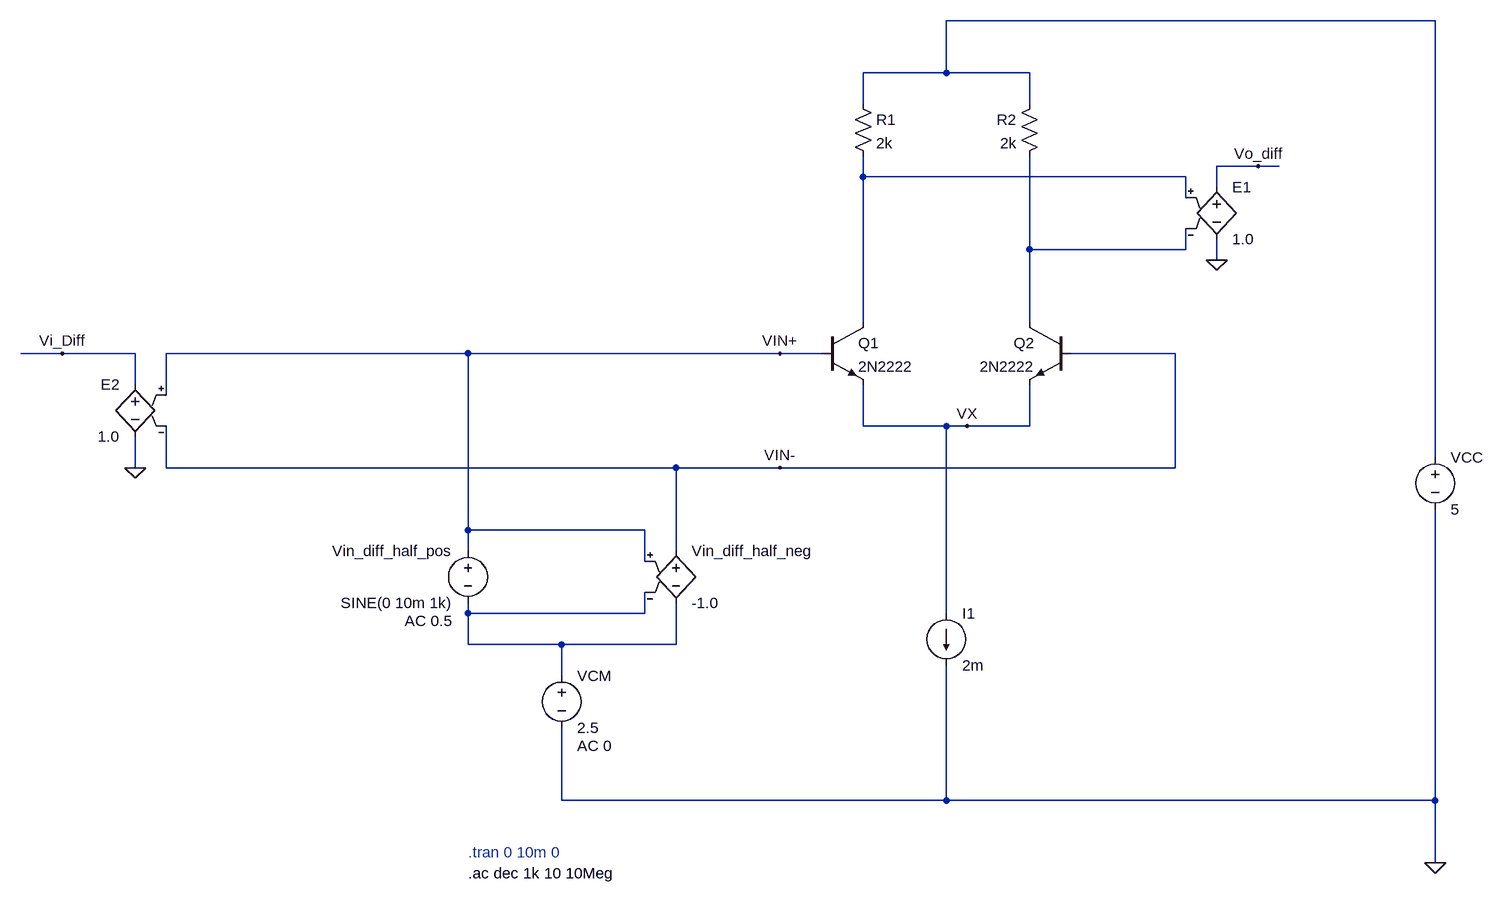
[diagram p0: schematic NPN_Differential_Pair.asc]
NPN_Differential_Pair.asc, the LTspice schematic file:
Version 4.1
SHEET 1 1128 960
WIRE 1056 -368 304 -368
WIRE 304 -288 304 -368
WIRE 304 -288 176 -288
WIRE 432 -288 304 -288
WIRE 176 -240 176 -288
WIRE 432 -240 432 -288
WIRE 784 -144 720 -144
WIRE 816 -144 784 -144
WIRE 176 -128 176 -160
WIRE 672 -128 176 -128
WIRE 720 -112 720 -144
WIRE 672 -96 672 -128
WIRE 432 -16 432 -160
WIRE 672 -16 672 -48
WIRE 672 -16 432 -16
WIRE 720 0 720 -32
WIRE 176 96 176 -128
WIRE 432 96 432 -16
WIRE -1056 144 -1120 144
WIRE -944 144 -1056 144
WIRE -432 144 -896 144
WIRE 48 144 -432 144
WIRE 112 144 48 144
WIRE 656 144 496 144
WIRE -944 192 -944 144
WIRE -896 208 -896 144
WIRE 176 256 176 192
WIRE 304 256 176 256
WIRE 336 256 304 256
WIRE 432 256 432 192
WIRE 432 256 336 256
WIRE 1056 304 1056 -368
WIRE -944 320 -944 272
WIRE -896 320 -896 256
WIRE -112 320 -896 320
WIRE 48 320 -112 320
WIRE 656 320 656 144
WIRE 656 320 48 320
WIRE -432 416 -432 144
WIRE -160 416 -432 416
WIRE -432 448 -432 416
WIRE -112 448 -112 320
WIRE -160 464 -160 416
WIRE -432 544 -432 528
WIRE -160 544 -160 512
WIRE -160 544 -432 544
WIRE 304 544 304 256
WIRE -432 592 -432 544
WIRE -288 592 -432 592
WIRE -112 592 -112 528
WIRE -112 592 -288 592
WIRE -288 640 -288 592
WIRE -288 832 -288 720
WIRE 304 832 304 624
WIRE 304 832 -288 832
WIRE 1056 832 1056 384
WIRE 1056 832 304 832
WIRE 1056 928 1056 832
FLAG 1056 928 0
FLAG 720 0 0
FLAG 784 -144 Vo_diff
FLAG 48 144 VIN+
FLAG 48 320 VIN-
FLAG 336 256 VX
FLAG -944 320 0
FLAG -1056 144 Vi_Diff
SYMBOL npn 112 96 R0
SYMATTR InstName Q1
SYMATTR Value 2N2222
SYMBOL npn 496 96 M0
SYMATTR InstName Q2
SYMATTR Value 2N2222
SYMBOL res 160 -256 R0
SYMATTR InstName R1
SYMATTR Value 2k
SYMBOL res 448 -256 M0
SYMATTR InstName R2
SYMATTR Value 2k
SYMBOL voltage 1056 288 R0
WINDOW 123 0 0 Left 0
WINDOW 39 0 0 Left 0
SYMATTR InstName VCC
SYMATTR Value 5
SYMBOL voltage -288 624 R0
WINDOW 123 24 124 Left 2
WINDOW 39 0 0 Left 0
SYMATTR InstName VCM
SYMATTR Value 2.5
SYMATTR Value2 AC 0
SYMBOL voltage -432 432 M0
WINDOW 123 24 124 Left 2
WINDOW 39 0 0 Left 0
SYMATTR InstName Vin_diff_half_pos
SYMATTR Value SINE(0 10m 1k)
SYMATTR Value2 AC 0.5
SYMBOL e -112 432 R0
SYMATTR InstName Vin_diff_half_neg
SYMATTR Value -1.0
SYMBOL e 720 -128 R0
SYMATTR InstName E1
SYMATTR Value 1.0
SYMBOL e -944 176 M0
SYMATTR InstName E2
SYMATTR Value 1.0
SYMBOL current 304 544 R0
WINDOW 123 0 0 Left 0
WINDOW 39 0 0 Left 0
SYMATTR InstName I1
SYMATTR Value 2m
TEXT -432 912 Left 2 ;.tran 0 10m 0
TEXT -432 944 Left 2 !.ac dec 1k 10 10Meg

The netlist it stands for:
* NPN_Differential_Pair.asc
Q1 N002 VIN+ VX 0 2N2222
Q2 N003 VIN- VX 0 2N2222
R1 N001 N002 2k
R2 N001 N003 2k
VCC N001 0 5
VCM N004 0 2.5 AC 0
Vin_diff_half_pos VIN+ N004 SINE(0 10m 1k) AC 0.5
E§Vin_diff_half_neg VIN- N004 VIN+ N004 -1.0
E1 Vo_diff 0 N002 N003 1.0
E2 Vi_Diff 0 VIN+ VIN- 1.0
I1 VX 0 2m
.model NPN NPN
.model PNP PNP
.lib standard.bjt
* .tran 0 10m 0
.ac dec 1k 10 10Meg
.backanno
.end